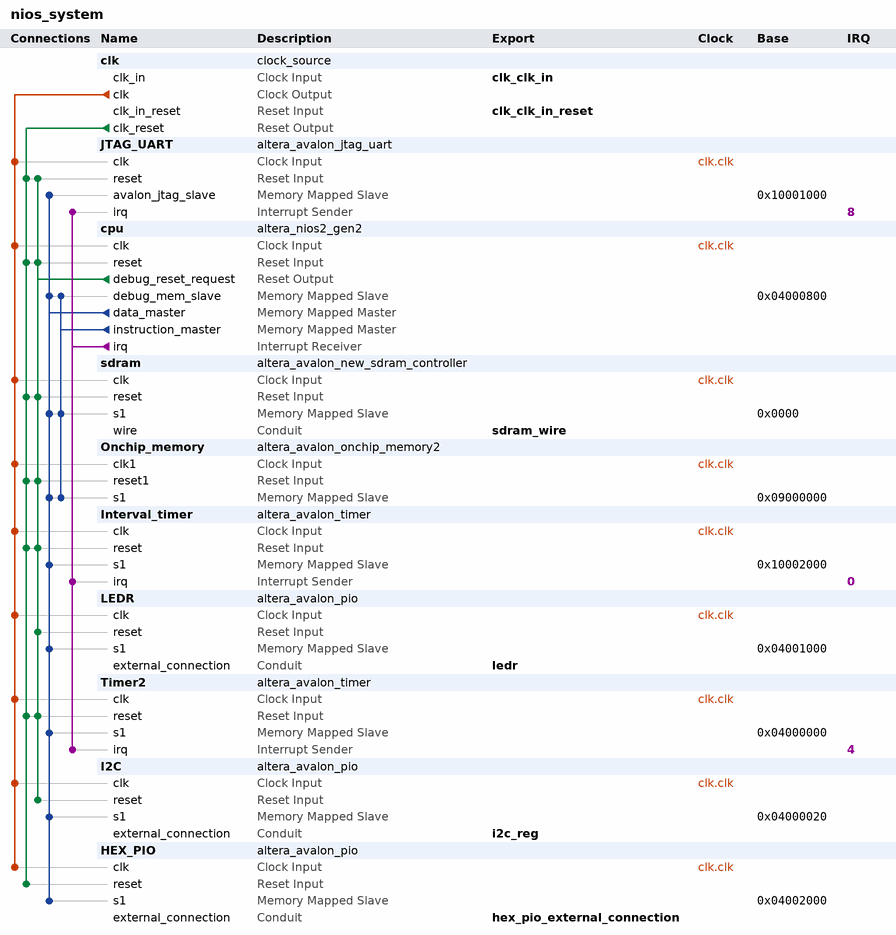
[diagram p0: system contents]
# Platform Designer (Qsys) system nios_system, Cyclone V 5CSEMA5F31C6
# Parameters at their usual value, and those the tool derives, are not listed.
package require -exact qsys 18.1
create_system nios_system
set_project_property DEVICE_FAMILY {Cyclone V}
set_project_property DEVICE 5CSEMA5F31C6

add_instance clk clock_source 18.1
set_instance_parameter_value clk clockFrequency 50000000

add_instance JTAG_UART altera_avalon_jtag_uart 18.1
set_instance_parameter_value JTAG_UART simInteractiveOptions INTERACTIVE_ASCII_OUTPUT

add_instance cpu altera_nios2_gen2 18.1
set_instance_parameter_value cpu dcache_size 2048
set_instance_parameter_value cpu exceptionSlave sdram.s1
set_instance_parameter_value cpu icache_size 4096
set_instance_parameter_value cpu impl Fast
set_instance_parameter_value cpu mmu_processIDNumBits 10
set_instance_parameter_value cpu resetSlave sdram.s1
set_instance_parameter_value cpu setting_activateTrace true

add_instance sdram altera_avalon_new_sdram_controller 18.1
set_instance_parameter_value sdram TAC 5.5
set_instance_parameter_value sdram TRCD 20.0
set_instance_parameter_value sdram TRP 20.0
set_instance_parameter_value sdram casLatency 3
set_instance_parameter_value sdram columnWidth 10
set_instance_parameter_value sdram dataWidth 16
set_instance_parameter_value sdram generateSimulationModel false
set_instance_parameter_value sdram model custom
set_instance_parameter_value sdram numberOfBanks 4
set_instance_parameter_value sdram numberOfChipSelects 1
set_instance_parameter_value sdram powerUpDelay 100.0
set_instance_parameter_value sdram refreshPeriod 7.8125
set_instance_parameter_value sdram rowWidth 13

add_instance Onchip_memory altera_avalon_onchip_memory2 18.1
set_instance_parameter_value Onchip_memory dataWidth 32
set_instance_parameter_value Onchip_memory dualPort false
set_instance_parameter_value Onchip_memory initMemContent true
set_instance_parameter_value Onchip_memory initializationFileName Onchip_memory
set_instance_parameter_value Onchip_memory memorySize 8192

add_instance Interval_timer altera_avalon_timer 18.1
set_instance_parameter_value Interval_timer period 500
set_instance_parameter_value Interval_timer periodUnits MSEC

add_instance LEDR altera_avalon_pio 18.1
set_instance_parameter_value LEDR direction Output
set_instance_parameter_value LEDR width 10

add_instance Timer2 altera_avalon_timer 18.1
set_instance_parameter_value Timer2 period 500
set_instance_parameter_value Timer2 periodUnits MSEC

add_instance I2C altera_avalon_pio 18.1
set_instance_parameter_value I2C direction InOut
set_instance_parameter_value I2C resetValue 17
set_instance_parameter_value I2C width 8

add_instance HEX_PIO altera_avalon_pio 18.1
set_instance_parameter_value HEX_PIO direction Output
set_instance_parameter_value HEX_PIO width 16

# connections
add_connection clk.clk cpu.clk clock
add_connection clk.clk HEX_PIO.clk clock
add_connection clk.clk I2C.clk clock
add_connection clk.clk Interval_timer.clk clock
add_connection clk.clk JTAG_UART.clk clock
add_connection clk.clk LEDR.clk clock
add_connection clk.clk Onchip_memory.clk1 clock
add_connection clk.clk sdram.clk clock
add_connection clk.clk Timer2.clk clock
add_connection clk.clk_reset cpu.reset reset
add_connection clk.clk_reset HEX_PIO.reset reset
add_connection clk.clk_reset Interval_timer.reset reset
add_connection clk.clk_reset JTAG_UART.reset reset
add_connection clk.clk_reset Onchip_memory.reset1 reset
add_connection clk.clk_reset sdram.reset reset
add_connection clk.clk_reset Timer2.reset reset
add_connection cpu.debug_reset_request cpu.reset reset
add_connection cpu.debug_reset_request I2C.reset reset
add_connection cpu.debug_reset_request Interval_timer.reset reset
add_connection cpu.debug_reset_request JTAG_UART.reset reset
add_connection cpu.debug_reset_request LEDR.reset reset
add_connection cpu.debug_reset_request Onchip_memory.reset1 reset
add_connection cpu.debug_reset_request sdram.reset reset
add_connection cpu.debug_reset_request Timer2.reset reset
add_connection cpu.data_master cpu.debug_mem_slave avalon
set_connection_parameter_value cpu.data_master/cpu.debug_mem_slave baseAddress 0x04000800
add_connection cpu.data_master HEX_PIO.s1 avalon
set_connection_parameter_value cpu.data_master/HEX_PIO.s1 baseAddress 0x04002000
add_connection cpu.data_master I2C.s1 avalon
set_connection_parameter_value cpu.data_master/I2C.s1 baseAddress 0x04000020
add_connection cpu.data_master Interval_timer.s1 avalon
set_connection_parameter_value cpu.data_master/Interval_timer.s1 baseAddress 0x10002000
add_connection cpu.data_master JTAG_UART.avalon_jtag_slave avalon
set_connection_parameter_value cpu.data_master/JTAG_UART.avalon_jtag_slave baseAddress 0x10001000
add_connection cpu.data_master LEDR.s1 avalon
set_connection_parameter_value cpu.data_master/LEDR.s1 baseAddress 0x04001000
add_connection cpu.data_master Onchip_memory.s1 avalon
set_connection_parameter_value cpu.data_master/Onchip_memory.s1 baseAddress 0x09000000
add_connection cpu.data_master sdram.s1 avalon
set_connection_parameter_value cpu.data_master/sdram.s1 baseAddress 0x0000
add_connection cpu.data_master Timer2.s1 avalon
set_connection_parameter_value cpu.data_master/Timer2.s1 baseAddress 0x04000000
add_connection cpu.instruction_master cpu.debug_mem_slave avalon
set_connection_parameter_value cpu.instruction_master/cpu.debug_mem_slave baseAddress 0x04000800
add_connection cpu.instruction_master Onchip_memory.s1 avalon
set_connection_parameter_value cpu.instruction_master/Onchip_memory.s1 baseAddress 0x09000000
add_connection cpu.instruction_master sdram.s1 avalon
set_connection_parameter_value cpu.instruction_master/sdram.s1 baseAddress 0x0000
add_connection cpu.irq Interval_timer.irq interrupt
set_connection_parameter_value cpu.irq/Interval_timer.irq irqNumber 0
add_connection cpu.irq JTAG_UART.irq interrupt
set_connection_parameter_value cpu.irq/JTAG_UART.irq irqNumber 8
add_connection cpu.irq Timer2.irq interrupt
set_connection_parameter_value cpu.irq/Timer2.irq irqNumber 4

# exported interfaces
add_interface clk_clk_in clock sink
set_interface_property clk_clk_in EXPORT_OF clk.clk_in
add_interface clk_clk_in_reset reset sink
set_interface_property clk_clk_in_reset EXPORT_OF clk.clk_in_reset
add_interface hex_pio_external_connection conduit end
set_interface_property hex_pio_external_connection EXPORT_OF HEX_PIO.external_connection
add_interface i2c_reg conduit end
set_interface_property i2c_reg EXPORT_OF I2C.external_connection
add_interface ledr conduit end
set_interface_property ledr EXPORT_OF LEDR.external_connection
add_interface sdram_wire conduit end
set_interface_property sdram_wire EXPORT_OF sdram.wire

set_interconnect_requirement {$system} qsys_mm.clockCrossingAdapter HANDSHAKE
set_interconnect_requirement {$system} qsys_mm.maxAdditionalLatency 0

save_system nios_system.qsys
